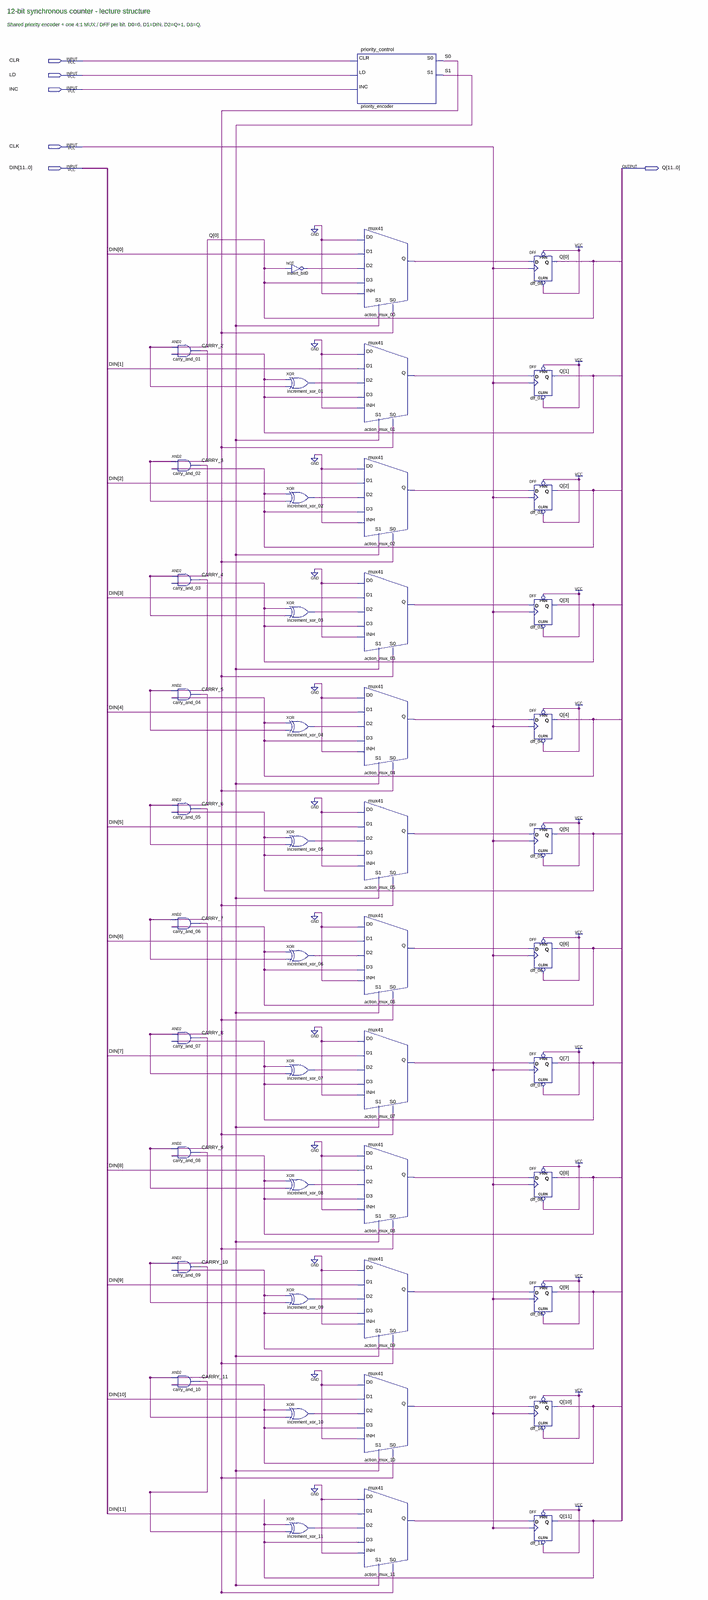
[diagram p0: schematic sheet, whole]
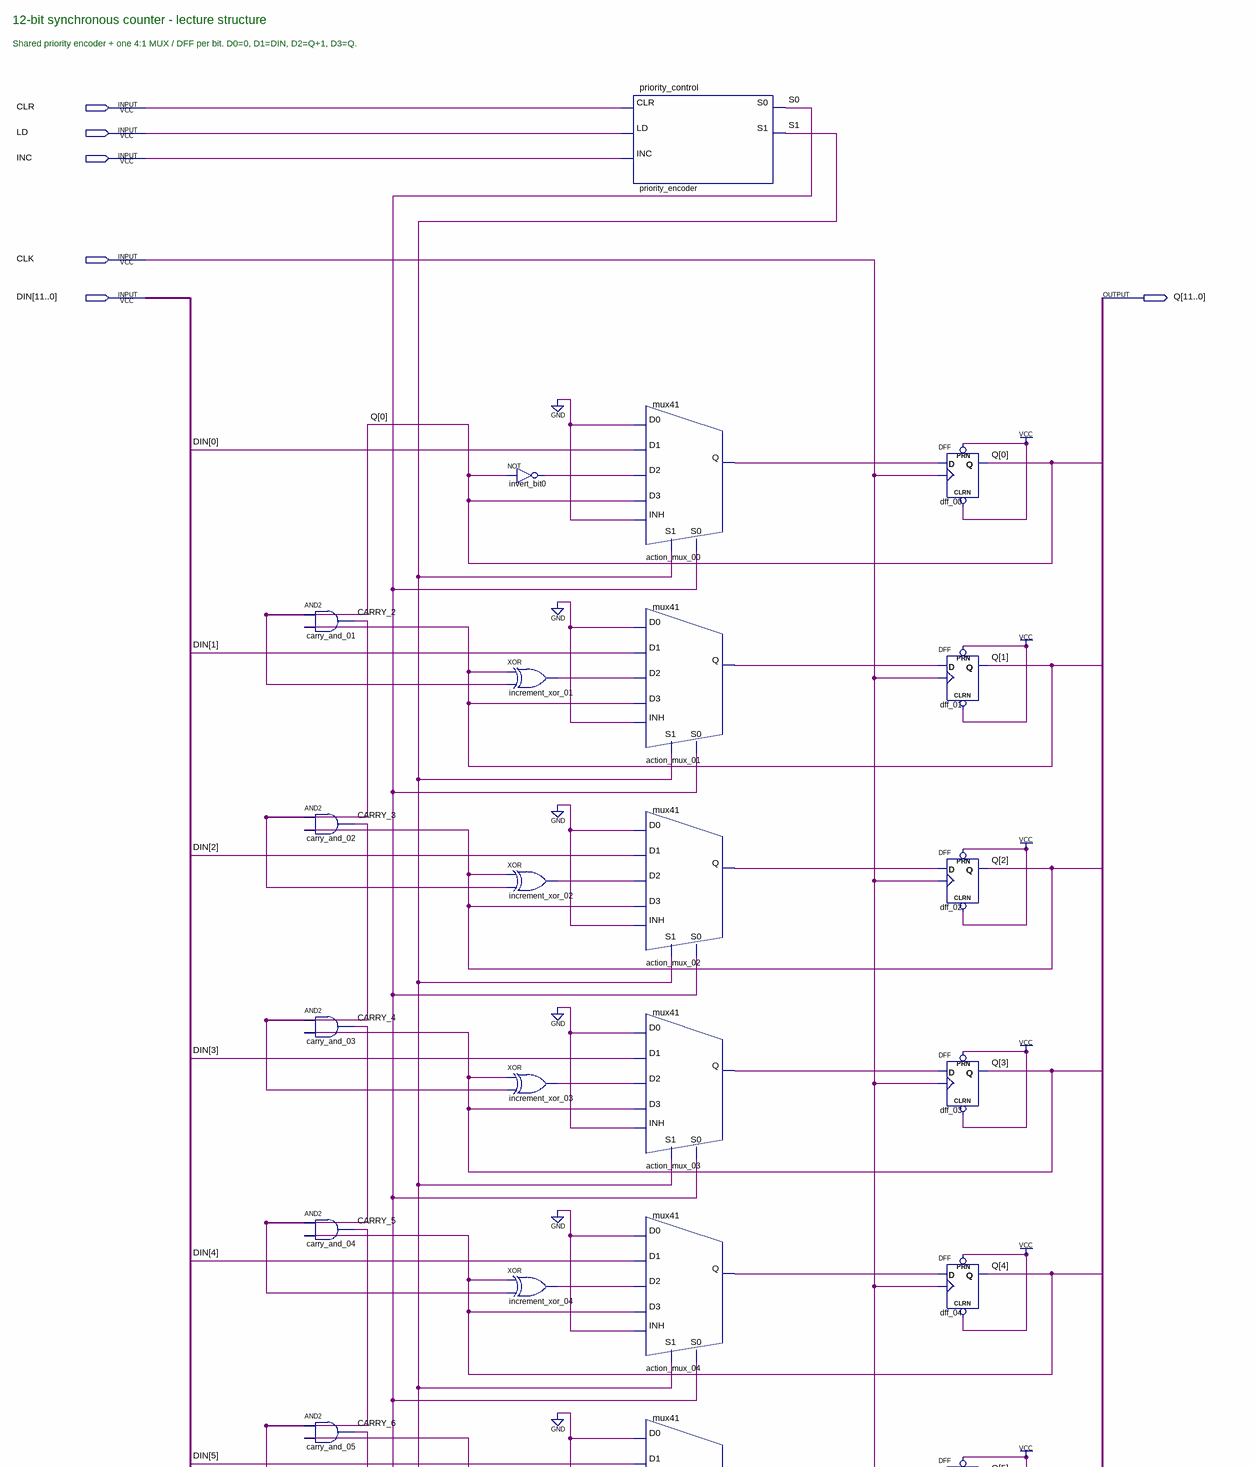
[diagram p1: schematic sheet, upper part]
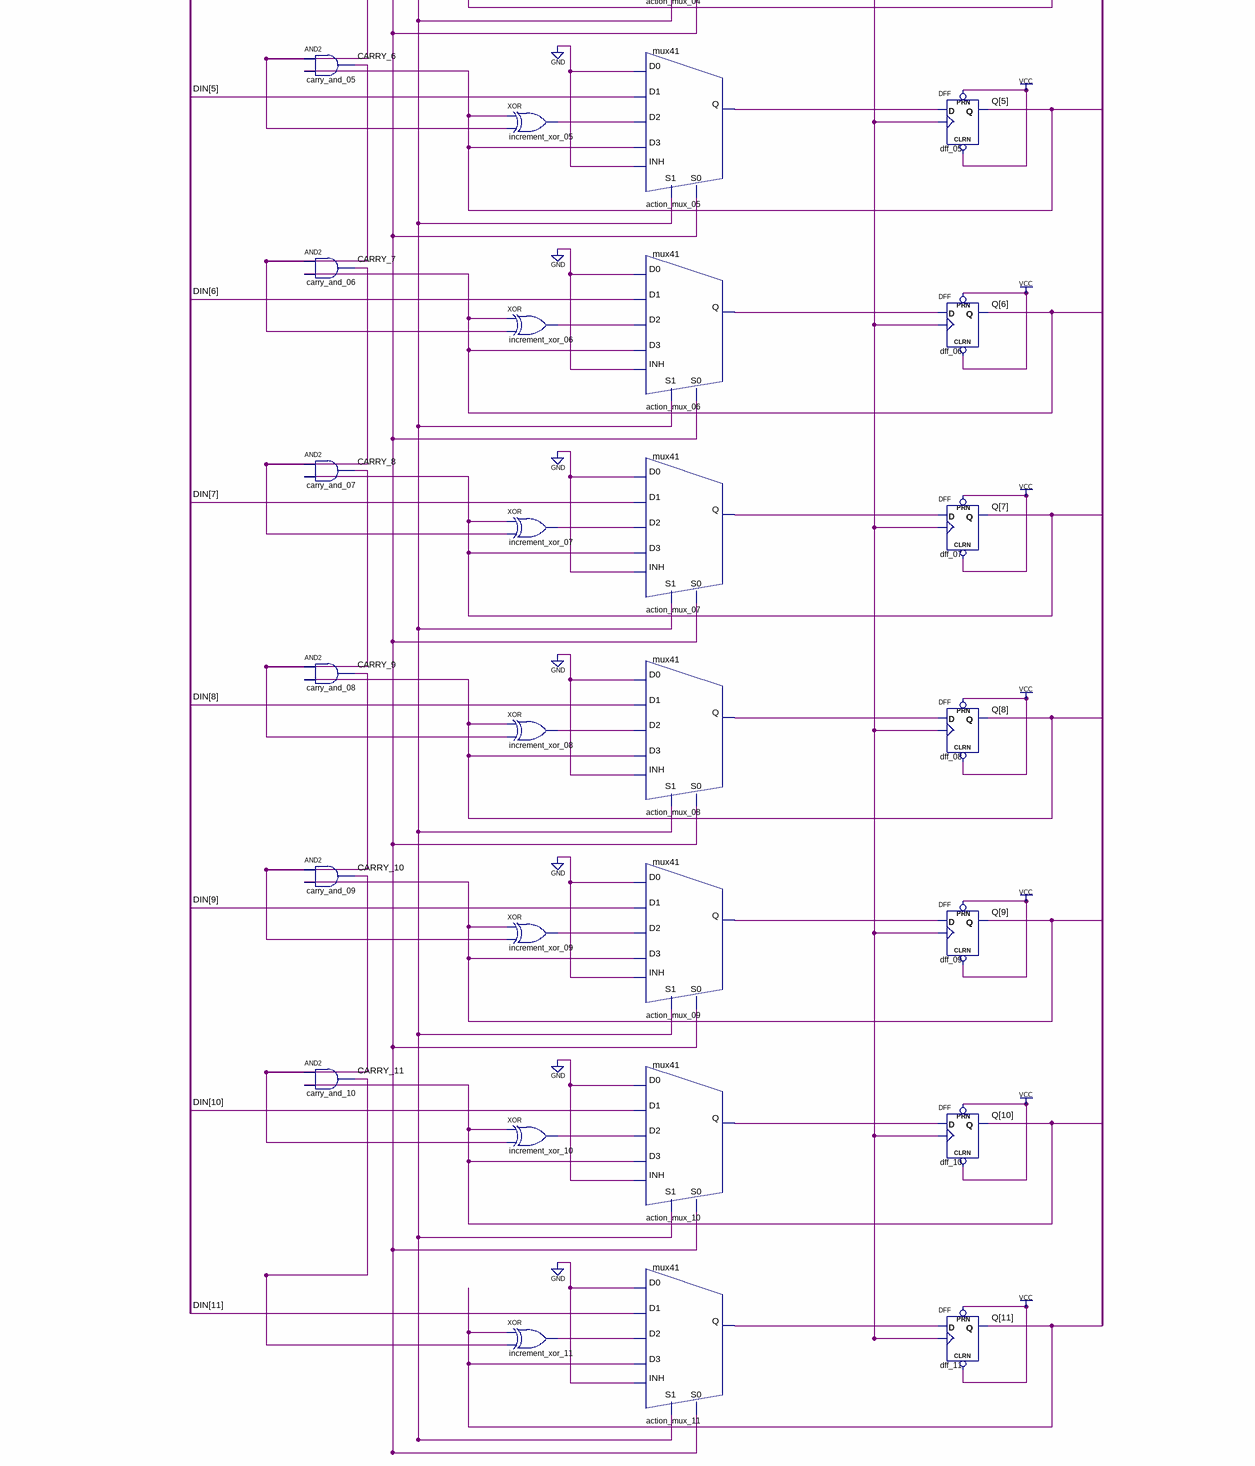
[diagram p2: schematic sheet, lower part]
// Quartus schematic counter12.bdf as structural Verilog: 47 symbols, 6 pins
module counter12 (
  input  CLR,
  input  LD,
  input  INC,
  input  CLK,
  input  [11:0] DIN,
  output [11:0] Q
);

  wire CARRY_2, CARRY_3, CARRY_4, CARRY_5, CARRY_6, CARRY_7, CARRY_8, CARRY_9, CARRY_10, CARRY_11, NEXT_0,
       NEXT_1, NEXT_2, NEXT_3, NEXT_4, NEXT_5, NEXT_6, NEXT_7, NEXT_8, NEXT_9, NEXT_10, NEXT_11, PLUS1_0,
       PLUS1_1, PLUS1_2, PLUS1_3, PLUS1_4, PLUS1_5, PLUS1_6, PLUS1_7, PLUS1_8, PLUS1_9, PLUS1_10, PLUS1_11,
       S0, S1;

  and carry_and_01 (CARRY_2, Q[0], Q[1]);
  and carry_and_02 (CARRY_3, CARRY_2, Q[2]);
  and carry_and_03 (CARRY_4, CARRY_3, Q[3]);
  and carry_and_04 (CARRY_5, CARRY_4, Q[4]);
  and carry_and_05 (CARRY_6, CARRY_5, Q[5]);
  and carry_and_06 (CARRY_7, CARRY_6, Q[6]);
  and carry_and_07 (CARRY_8, CARRY_7, Q[7]);
  and carry_and_08 (CARRY_9, CARRY_8, Q[8]);
  and carry_and_09 (CARRY_10, CARRY_9, Q[9]);
  and carry_and_10 (CARRY_11, CARRY_10, Q[10]);
  not invert_bit0 (PLUS1_0, Q[0]);
  xor increment_xor_01 (PLUS1_1, Q[1], Q[0]);
  xor increment_xor_02 (PLUS1_2, Q[2], CARRY_2);
  xor increment_xor_03 (PLUS1_3, Q[3], CARRY_3);
  xor increment_xor_04 (PLUS1_4, Q[4], CARRY_4);
  xor increment_xor_05 (PLUS1_5, Q[5], CARRY_5);
  xor increment_xor_06 (PLUS1_6, Q[6], CARRY_6);
  xor increment_xor_07 (PLUS1_7, Q[7], CARRY_7);
  xor increment_xor_08 (PLUS1_8, Q[8], CARRY_8);
  xor increment_xor_09 (PLUS1_9, Q[9], CARRY_9);
  xor increment_xor_10 (PLUS1_10, Q[10], CARRY_10);
  xor increment_xor_11 (PLUS1_11, Q[11], CARRY_11);
  priority_control priority_encoder (.CLR(CLR), .LD(LD), .INC(INC), .S0(S0), .S1(S1));
  mux41 action_mux_00 (.D0(1'b0), .D1(DIN[0]), .D2(PLUS1_0), .D3(Q[0]), .INH(1'b0), .S1(S1), .S0(S0), .Q(NEXT_0));
  mux41 action_mux_01 (.D0(1'b0), .D1(DIN[1]), .D2(PLUS1_1), .D3(Q[1]), .INH(1'b0), .S1(S1), .S0(S0), .Q(NEXT_1));
  mux41 action_mux_02 (.D0(1'b0), .D1(DIN[2]), .D2(PLUS1_2), .D3(Q[2]), .INH(1'b0), .S1(S1), .S0(S0), .Q(NEXT_2));
  mux41 action_mux_03 (.D0(1'b0), .D1(DIN[3]), .D2(PLUS1_3), .D3(Q[3]), .INH(1'b0), .S1(S1), .S0(S0), .Q(NEXT_3));
  mux41 action_mux_04 (.D0(1'b0), .D1(DIN[4]), .D2(PLUS1_4), .D3(Q[4]), .INH(1'b0), .S1(S1), .S0(S0), .Q(NEXT_4));
  mux41 action_mux_05 (.D0(1'b0), .D1(DIN[5]), .D2(PLUS1_5), .D3(Q[5]), .INH(1'b0), .S1(S1), .S0(S0), .Q(NEXT_5));
  mux41 action_mux_06 (.D0(1'b0), .D1(DIN[6]), .D2(PLUS1_6), .D3(Q[6]), .INH(1'b0), .S1(S1), .S0(S0), .Q(NEXT_6));
  mux41 action_mux_07 (.D0(1'b0), .D1(DIN[7]), .D2(PLUS1_7), .D3(Q[7]), .INH(1'b0), .S1(S1), .S0(S0), .Q(NEXT_7));
  mux41 action_mux_08 (.D0(1'b0), .D1(DIN[8]), .D2(PLUS1_8), .D3(Q[8]), .INH(1'b0), .S1(S1), .S0(S0), .Q(NEXT_8));
  mux41 action_mux_09 (.D0(1'b0), .D1(DIN[9]), .D2(PLUS1_9), .D3(Q[9]), .INH(1'b0), .S1(S1), .S0(S0), .Q(NEXT_9));
  mux41 action_mux_10 (.D0(1'b0), .D1(DIN[10]), .D2(PLUS1_10), .D3(Q[10]), .INH(1'b0), .S1(S1), .S0(S0), .Q(NEXT_10));
  mux41 action_mux_11 (.D0(1'b0), .D1(DIN[11]), .D2(PLUS1_11), .D3(Q[11]), .INH(1'b0), .S1(S1), .S0(S0), .Q(NEXT_11));
  DFF dff_00 (.CLRN(1'b1), .CLK(CLK), .D(NEXT_0), .PRN(1'b1), .Q(Q[0]));
  DFF dff_01 (.CLRN(1'b1), .CLK(CLK), .D(NEXT_1), .PRN(1'b1), .Q(Q[1]));
  DFF dff_02 (.CLRN(1'b1), .CLK(CLK), .D(NEXT_2), .PRN(1'b1), .Q(Q[2]));
  DFF dff_03 (.CLRN(1'b1), .CLK(CLK), .D(NEXT_3), .PRN(1'b1), .Q(Q[3]));
  DFF dff_04 (.CLRN(1'b1), .CLK(CLK), .D(NEXT_4), .PRN(1'b1), .Q(Q[4]));
  DFF dff_05 (.CLRN(1'b1), .CLK(CLK), .D(NEXT_5), .PRN(1'b1), .Q(Q[5]));
  DFF dff_06 (.CLRN(1'b1), .CLK(CLK), .D(NEXT_6), .PRN(1'b1), .Q(Q[6]));
  DFF dff_07 (.CLRN(1'b1), .CLK(CLK), .D(NEXT_7), .PRN(1'b1), .Q(Q[7]));
  DFF dff_08 (.CLRN(1'b1), .CLK(CLK), .D(NEXT_8), .PRN(1'b1), .Q(Q[8]));
  DFF dff_09 (.CLRN(1'b1), .CLK(CLK), .D(NEXT_9), .PRN(1'b1), .Q(Q[9]));
  DFF dff_10 (.CLRN(1'b1), .CLK(CLK), .D(NEXT_10), .PRN(1'b1), .Q(Q[10]));
  DFF dff_11 (.CLRN(1'b1), .CLK(CLK), .D(NEXT_11), .PRN(1'b1), .Q(Q[11]));

  // Notes on the sheet:
  //   12-bit synchronous counter - lecture structure
  //   Shared priority encoder + one 4:1 MUX / DFF per bit. D0=0, D1=DIN, D2=Q+1, D3=Q.
endmodule
